# Altium schematic sheet signal-light-15.SchDoc
size A4; SheetNumber: 18; SheetTotal: 21
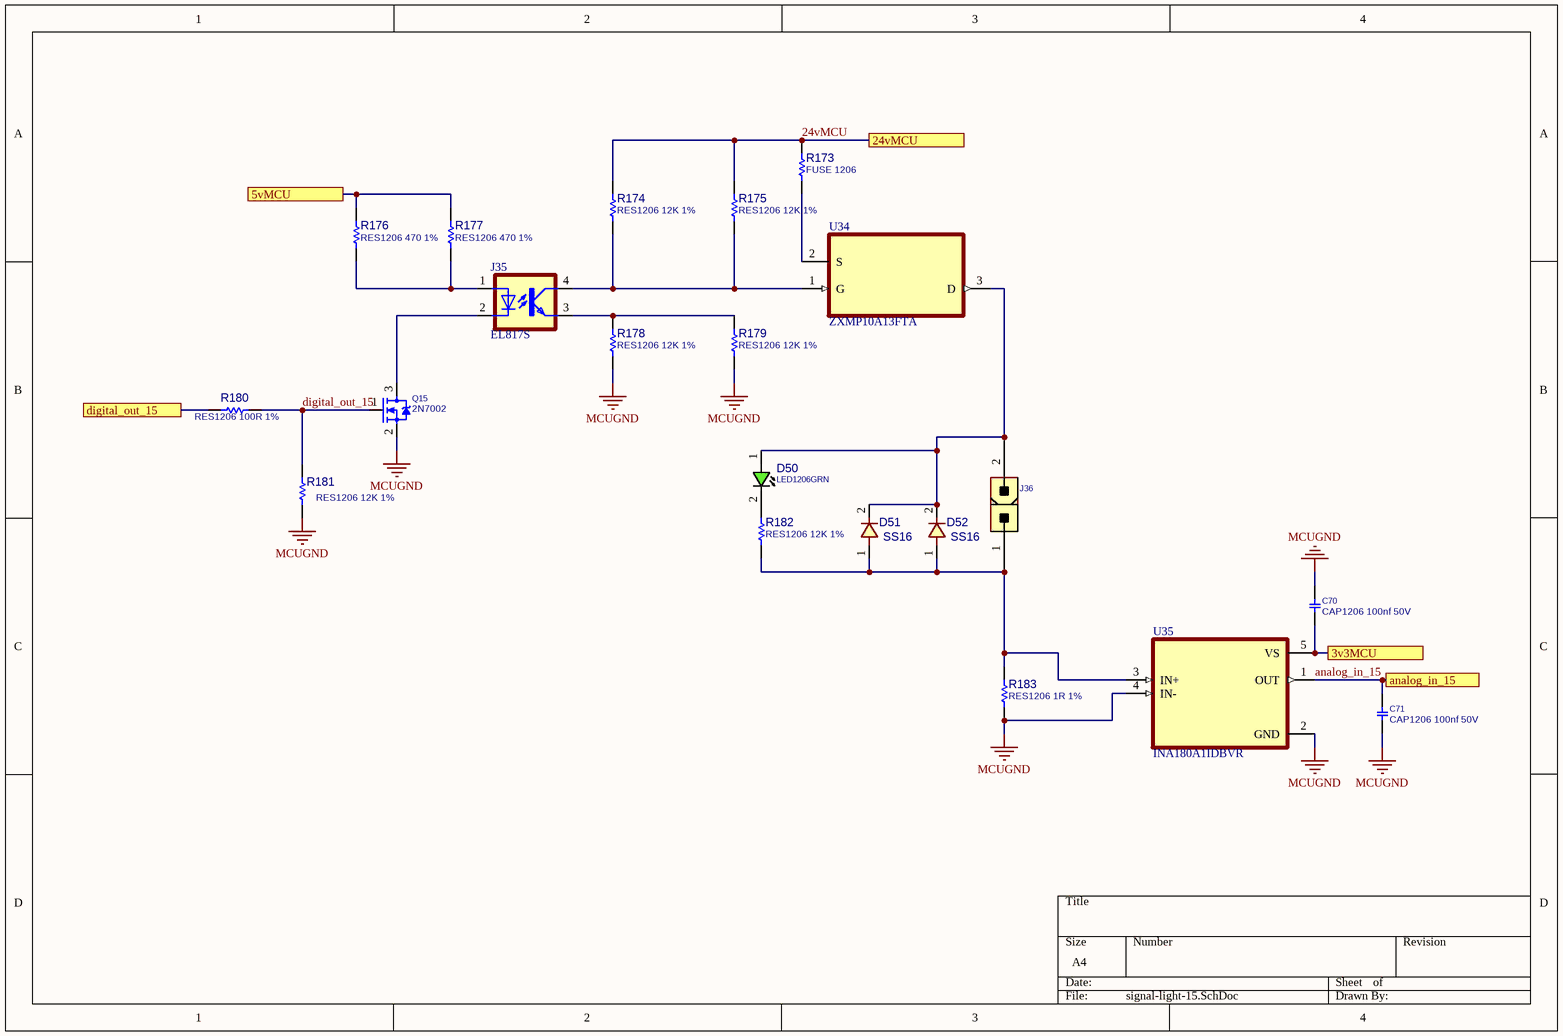
[diagram p0: signal-light-15.SchDoc]

## Parts
C70  CAP1206 100nf 50V  [C1206]
C71  CAP1206 100nf 50V  [C1206]
D50  LED1206GRN  [LED1206GRN]
D51  SS16  [D_SMA]
D52  SS16  [D_SMA]
J35  EL817S  [SOIC254P1030X460-4N]
J36  CONN_ATXPWR_2  [ATXPWR_2]  (value not drawn)
Q15  2N7002  [SOT23_3]
R173  FUSE 1206  [R1206]
R174  RES1206 12K 1%  [R1206]
R175  RES1206 12K 1%  [R1206]
R176  RES1206 470 1%  [R1206]
R177  RES1206 470 1%  [R1206]
R178  RES1206 12K 1%  [R1206]
R179  RES1206 12K 1%  [R1206]
R180  RES1206 100R 1%  [R1206]
R181  RES1206 12K 1%  [R1206]
R182  RES1206 12K 1%  [R1206]
R183  RES1206 1R 1%  [R1206]
U34  ZXMP10A13FTA  [SOT95P230X110-3N]
U35  INA180A1IDBVR  [SOT95P280X145-5N]

## Ports
3v3MCU, 5vMCU, 24vMCU, analog_in_15, digital_out_15

## Nets
MCUGND: C70.1 C71.2 Q15.2(SOURCE) R178.2 R179.2 R181.2 R183.2 U35.2(GND) U35.4(IN-)
3v3MCU: C70.2 U35.5(VS) ; port 3v3MCU
5vMCU: R176.2 R177.2 ; port 5vMCU
24vMCU: R173.1 R174.1 R175.1 ; port 24vMCU
analog_in_15: C71.1 U35.1(OUT) ; port analog_in_15
digital_out_15: Q15.1(GATE) R180.2 R181.1
digital_out_15: R180.1 ; port digital_out_15  [a separate net that carries the same name]
NetD50_1: D50.1(ANODE) D51.2 D52.2 J36.2 U34.3(D)
NetD50_2: D50.2(CATHODE) R182.1
NetD51_1: D51.1 D52.1 J36.1 R182.2 R183.1 U35.3(IN+)
NetJ35_1: J35.1(A) R176.1 R177.1
NetJ35_2: J35.2(C) Q15.3(DRAIN)
NetJ35_3: J35.3(EMIT) R178.1 R179.1
NetJ35_4: J35.4(COL) R174.2 R175.2 U34.1(G)
NetR173_2: R173.2 U34.2(S)

## Library data of the parts
C70 C71 = CAP_SMD_MLCC_1206: CAP, MLCC; PARAM: -, -%; MANF_P#: MANF_PART#; PARAM2: -V; PRICE: 100= 1$; MANF: -; ASSEMBLY: ASSEMBLY
D50 = LED_SMD_1206_GRN: LED, SMD, 1206, GREEN; PARAM: 20mA; DESC: DESCRIPTION; PARAM2: 2.2V; MANF: -; ASSEMBLY: ASSEMBLY; PRICE: 36t@Javan; MANF_P#: -; VALUE: LED1206GRN; MountType: SMT; PartType: LED
D51 D52 = DIODE_SMD_1N4001: DIODE, GENERAL PURPOSE, 50V/1A; DESC: DESCRIPTION; PARAM: 50V VRRM; PARAM2: 1A; MANF_P#: 1N4001; MANF: MANF; ASSEMBLY: ASSEMBLY; PRICE: PRICE; VALUE: SS16
J35 = EL817S: Optoisolator Transistor Output 5000Vrms 1 Channel 4-SMD; MF: Everlight Electronics; SnapEDA_Link: https://www.snapeda.com/parts/EL817S/Everlight+Electronics+Co+Ltd/view-part/?ref=snap; Package: SMD-4 Everlight Electronics Co Ltd; Value: *; MP: EL817S; Check_prices: https://www.snapeda.com/parts/EL817S/Everlight+Electronics+Co+Ltd/view-part/?ref=eda
J36 = CONN_ATXPWR_2: CONN, ATX POWER, 2 P; MANF: Molex; MANF_P#: 39281023; VALUE: CONN_ATXPWR_2; MountType: THD; PACKAGE: ATXPWR-2pin; Part Type: Conn.
Q15 = MOSN_2N7002_SOT23: MOSFET, N-CH, 60V, 0.3A; MANF: NXP; ASSEMBLY: ASSEMBLY; MANF_P#: 2N7002; PARAM2: 60v; PARAM: 0.3A; PRICE: 0.3t@Javan; VALUE: 2N7002
R173-R183 = RES_SMD_1206: RESISTOR, SMD; PARAM: 1%, 0.25W; DESC: DESCRIPTION; DIST#: MOUSER; MANF_P#: -; MANF: -; ASSEMBLY: ASSEMBLY; PRICE: -; PARAM2: -
U34 = ZXMP10A13FTA: P-Channel 100 V 600mA (Ta) 625mW (Ta) Surface Mount SOT-23-3; MF: Diodes Inc.; Purchase-URL: https://pricing.snapeda.com/search/part/ZXMP10A13FTA/?ref=eda; Package: SOT-23-3 Diodes Inc.; SnapEDA_Link: https://www.snapeda.com/parts/ZXMP10A13FTA/Diodes+Inc./view-part/?ref=snap; Availability: In Stock; Value: *; MP: ZXMP10A13FTA; Check_prices: https://www.snapeda.com/parts/ZXMP10A13FTA/Diodes+Inc./view-part/?ref=eda; Price: None
U35 = INA180A1IDBVR: 26V, 350kHz current sense amplifier; MF: Texas Instruments; SnapEDA_Link: https://www.snapeda.com/parts/INA180A1IDBVR/Texas+Instruments/view-part/?ref=snap; Package: SOT-23-5 Texas Instruments; Value: *; MP: INA180A1IDBVR; Check_prices: https://www.snapeda.com/parts/INA180A1IDBVR/Texas+Instruments/view-part/?ref=eda